# Altium schematic sheet Controller_Section.SchDoc
size A4; SheetNumber: 3; SheetTotal: 6
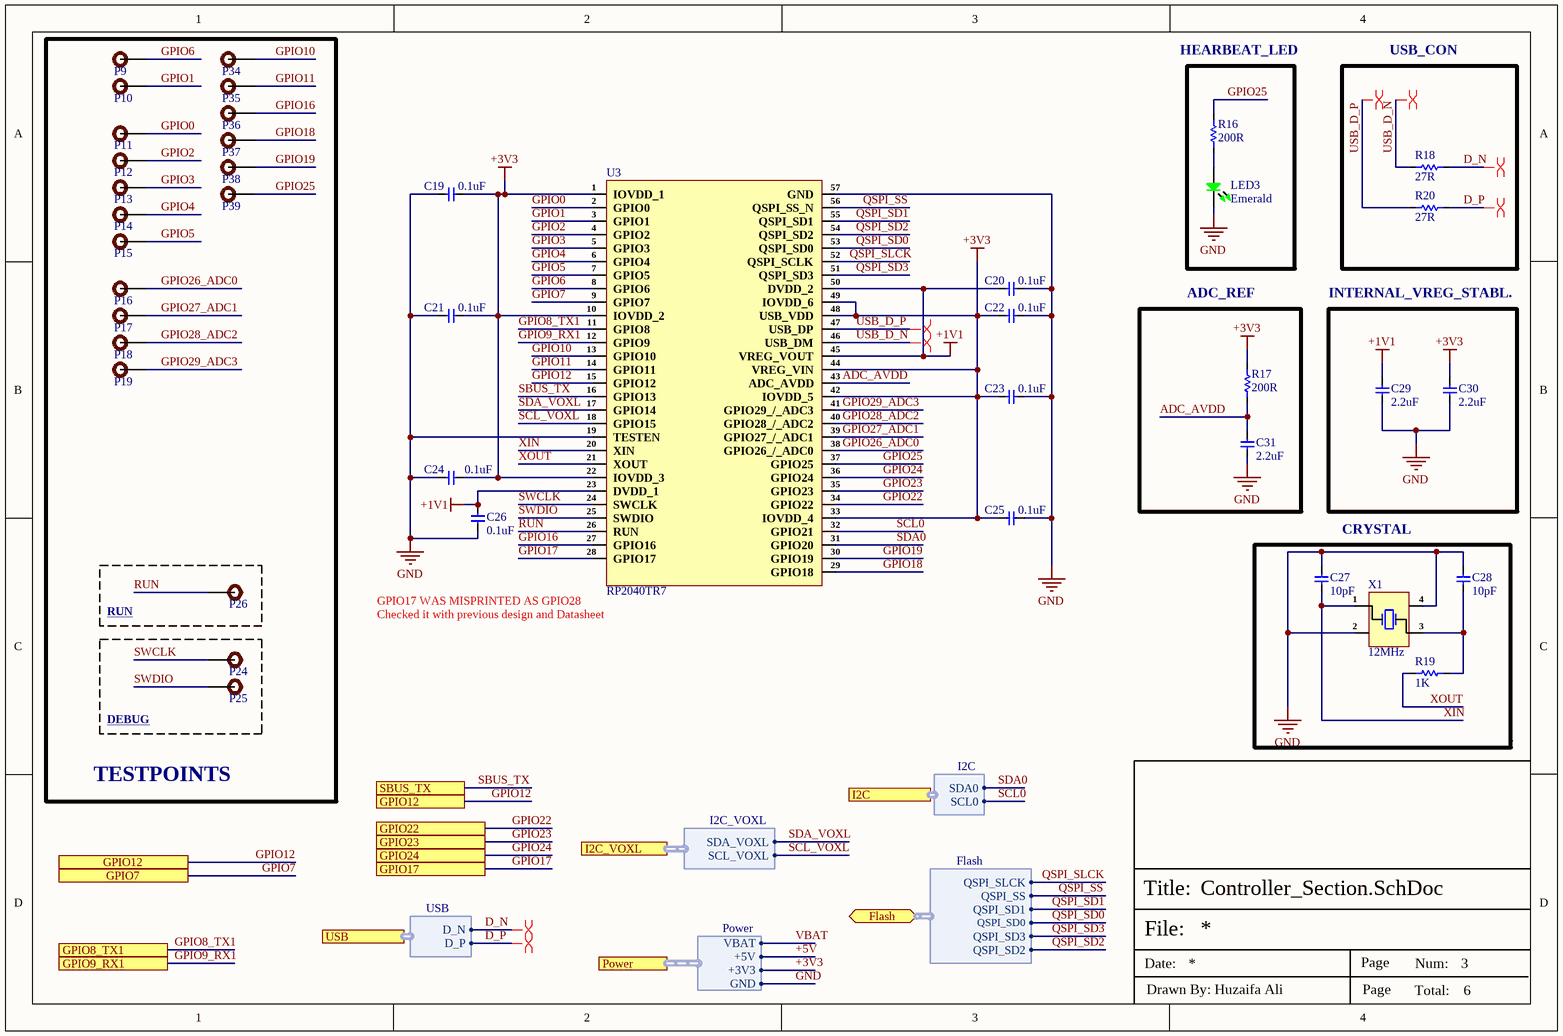
[diagram p0: Controller_Section.SchDoc]

## Parts
C19  0.1uF  [Cap-0603]
C20  0.1uF  [Cap-0603]
C21  0.1uF  [Cap-0603]
C22  0.1uF  [Cap-0603]
C23  0.1uF  [Cap-0603]
C24  0.1uF  [Cap-0603]
C25  0.1uF  [Cap-0603]
C26  0.1uF  [Cap-0603]
C27  10pF  [Cap-0603]
C28  10pF  [Cap-0603]
C29  2.2uF  [CAP-0603]
C30  2.2uF  [CAP-0603]
C31  2.2uF  [CAP-0603]
LED3  Emerald  [LED-0603]
P9  TEST POINT  [Test-point]  (value not drawn)
P10  TEST POINT  [Test-point]  (value not drawn)
P11  TEST POINT  [Test-point]  (value not drawn)
P12  TEST POINT  [Test-point]  (value not drawn)
P13  TEST POINT  [Test-point]  (value not drawn)
P14  TEST POINT  [Test-point]  (value not drawn)
P15  TEST POINT  [Test-point]  (value not drawn)
P16  TEST POINT  [Test-point]  (value not drawn)
P17  TEST POINT  [Test-point]  (value not drawn)
P18  TEST POINT  [Test-point]  (value not drawn)
P19  TEST POINT  [Test-point]  (value not drawn)
P24  TEST POINT  [Test-point]  (value not drawn)
P25  TEST POINT  [Test-point]  (value not drawn)
P26  TEST POINT  [Test-point]  (value not drawn)
P34  TEST POINT  [Test-point]  (value not drawn)
P35  TEST POINT  [Test-point]  (value not drawn)
P36  TEST POINT  [Test-point]  (value not drawn)
P37  TEST POINT  [Test-point]  (value not drawn)
P38  TEST POINT  [Test-point]  (value not drawn)
P39  TEST POINT  [Test-point]  (value not drawn)
R16  200R  [Res-0603]
R17  200R  [Res-0603]
R18  27R  [Res-0603]
R19  1K  [Res-0603]
R20  27R  [Res-0603]
U3  RP2040TR7  [QFN-56 (7x7)]
X1  12MHz  [MCSJK-7U-12.00-10-10-80-B-10]

## Blocks framed on the sheet
TESTPOINTS: P9-P19 P34-P39
USB_CON: R18 R20
ADC_REF: C31 R17
INTERNAL_VREG_STABL.: C29 C30
RUN: P26
DEBUG: P24 P25

## Ports
Flash (bidir, harness Flash, see Top-Sheet[3B], FlashMemory_Section[2D]), GPIO7 (see Top-Sheet[2B], Connector_Section[2D]), GPIO8_TX1 (see Top-Sheet[3C], WiFiModule_Section[2D]), GPIO9_RX1 (see Top-Sheet[3C], WiFiModule_Section[2D]), GPIO12 (see Top-Sheet[2C], Connector_Section[1D]), GPIO17 (see Top-Sheet[2C], Power_Section[2D]), GPIO22 (see Top-Sheet[2C], Power_Section[2D]), GPIO23 (see Top-Sheet[2C], Power_Section[2D]), GPIO24 (see Top-Sheet[2C], Power_Section[2D]), I2C (harness I2C, see Top-Sheet[2B], Connector_Section[1D]), I2C_VOXL (harness I2C_VOXL, see Top-Sheet[2B], Connector_Section[2D]), Power (harness Power, see Top-Sheet[2B], Connector_Section[4D], FlashMemory_Section[1D], Power_Section[3D], WiFiModule_Section[2D]), SBUS_TX (see Top-Sheet[2B], Connector_Section[1D]), USB (harness USB, see Top-Sheet[3C], WiFiModule_Section[2D])

## Harnesses
Flash: QSPI_SLCK, QSPI_SS, QSPI_SD1, QSPI_SD3, QSPI_SD0, QSPI_SD2
Power: +5V, +3V3, GND, VBAT
I2C_VOXL: SCL_VOXL, SDA_VOXL
I2C: SDA0, SCL0
USB: D_N, D_P

## Nets
+1V1: C20.2 C26.2 C29.2 U3.23(DVDD_1) U3.45(VREG_VOUT) U3.50(DVDD_2)
+3V3: C19.1 C21.1 C22.2 C23.2 C24.1 C25.2 C30.2 R17.2 U3.1(IOVDD_1) U3.10(IOVDD_2) U3.22(IOVDD_3) U3.33(IOVDD_4) U3.42(IOVDD_5) U3.44(VREG_VIN) U3.48(USB_VDD) U3.49(IOVDD_6) ; port Power.+3V3
GND: C19.2 C20.1 C21.2 C22.1 C23.1 C24.2 C25.1 C26.1 C27.2 C28.2 C29.1 C30.1 C31.1 LED3.2 U3.19(TESTEN) U3.57(GND) X1.2(GND) X1.4(VDD) ; port Power.GND
+5V: port Power.+5V
ADC_AVDD: C31.2 R17.1 U3.43(ADC_AVDD)
D_N: R18.2 ; port USB.D_N
D_P: R20.2 ; port USB.D_P
GPIO0: P11.1 U3.2(GPIO0)
GPIO1: P10.1 U3.3(GPIO1)
GPIO2: P12.1 U3.4(GPIO2)
GPIO3: P13.1 U3.5(GPIO3)
GPIO4: P14.1 U3.6(GPIO4)
GPIO5: P15.1 U3.7(GPIO5)
GPIO6: P9.1 U3.8(GPIO6)
GPIO7: U3.9(GPIO7) ; port GPIO7
GPIO8_TX1: U3.11(GPIO8) ; port GPIO8_TX1
GPIO9_RX1: U3.12(GPIO9) ; port GPIO9_RX1
GPIO10: P34.1 U3.13(GPIO10)
GPIO11: P35.1 U3.14(GPIO11)
GPIO12: U3.15(GPIO12) ; port GPIO12
GPIO16: P36.1 U3.27(GPIO16)
GPIO17: U3.28(GPIO17) ; port GPIO17
GPIO18: P37.1 U3.29(GPIO18)
GPIO19: P38.1 U3.30(GPIO19)
GPIO22: U3.34(GPIO22) ; port GPIO22
GPIO23: U3.35(GPIO23) ; port GPIO23
GPIO24: U3.36(GPIO24) ; port GPIO24
GPIO25: P39.1 R16.2 U3.37(GPIO25)
GPIO26_ADC0: P16.1 U3.38(GPIO26_/_ADC0)
GPIO27_ADC1: P17.1 U3.39(GPIO27_/_ADC1)
GPIO28_ADC2: P18.1 U3.40(GPIO28_/_ADC2)
GPIO29_ADC3: P19.1 U3.41(GPIO29_/_ADC3)
QSPI_SD0: U3.53(QSPI_SD0) ; port Flash.QSPI_SD0
QSPI_SD1: U3.55(QSPI_SD1) ; port Flash.QSPI_SD1
QSPI_SD2: U3.54(QSPI_SD2) ; port Flash.QSPI_SD2
QSPI_SD3: U3.51(QSPI_SD3) ; port Flash.QSPI_SD3
QSPI_SLCK: U3.52(QSPI_SCLK) ; port Flash.QSPI_SLCK
QSPI_SS: U3.56(QSPI_SS_N) ; port Flash.QSPI_SS
RUN: P26.1 U3.26(RUN)
SBUS_TX: U3.16(GPIO13) ; port SBUS_TX
SCL0: U3.32(GPIO21) ; port I2C.SCL0
SCL_VOXL: U3.18(GPIO15) ; port I2C_VOXL.SCL_VOXL
SDA0: U3.31(GPIO20) ; port I2C.SDA0
SDA_VOXL: U3.17(GPIO14) ; port I2C_VOXL.SDA_VOXL
SWCLK: P24.1 U3.24(SWCLK)
SWDIO: P25.1 U3.25(SWDIO)
USB_D_N: R18.1 U3.46(USB_DM)
USB_D_P: R20.1 U3.47(USB_DP)
VBAT: port Power.VBAT
XIN: C27.1 U3.20(XIN) X1.1(ENABLE_CONTROL)
XOUT: R19.1 U3.21(XOUT)
NetC28_1: C28.1 R19.2 X1.3(OUT_PUT)
NetLED3_1: LED3.1 R16.1

## Layout directives
differential pair; net class USB_D; differential pair class USB_D_Lines; rule Matched Net Lengths [Tolerance = 0.508mm]; rule Impedance Constraint [Min = 88.00    Max = 102.0    ]: USB_D_N, USB_D_P
differential pair; rule Impedance Constraint [Min = 88.00    Max = 102.0    ]; rule Matched Net Lengths [Tolerance = 0.508mm]; net class D; differential pair class D_Lines: D_N, D_P

## Notes on the sheet
- HEARBEAT_LED
- (near C27) CRYSTAL
- (near U3) GPIO17 WAS MISPRINTED AS GPIO28
  Checked it with previous design and Datasheet
- File:
- Title:
- Date:
- Page
- Num:
- Total:
- Drawn By: Huzaifa Ali

## Library data of the parts
C19-C26 = CL10B104KB8NNNC: CAP CER 0.1UF 50V X7R 0603; Manufacturer: Samsung; Material: Ceramic; Capacitance: 100nF; Tolerance: 10%; Supplier 1: Digi-Key; Manufacturer Part Number: CL10B104KB8NNNC; RoHS: Yes; Category: Ceramic Capacitors; Stock 1: 3998791; Pricing 1: 1=0.10000, 10=0.03000, 50=0.01640, 100=0.01340, 500=0.00954, 1000=0.00750 (USD); Mount: Surface Mount; Case/Package: 0603; Case Code (Metric): 1608; Case Code (Imperial): 0603; Contact Plating: Tin; Min Operating Temperature: -55°C; Max Operating Temperature: 125°C; Dielectric: X7R; Voltage Rating: 50V; Package Quantity: 1; Packaging: Tape and Reel; Voltage: 50V; Voltage Rating (DC): 50V; Series: CL; Construction: Flat; Length: 1.6mm; Width: 0.031inch; Height: 0.8mm; Depth: 0.8mm; Thickness: 0.035inch; Radiation Hardening: No; Lead Free: Lead Free; RoHS Compliant: Yes; ComponentLink1URL: https://datasheet.ciiva.com/25803/cl10b104kb8nnnc-25803393.pdf?src-supplier=Digi-Key; ComponentLink1Description: https://datasheet.ciiva.com/25803/cl10b104kb8nnnc-25803393.pdf?src-supplier=Digi-Key; ComponentLink2URL: https://datasheet.ciiva.com/26838/getdatasheetpartid-89097-26838411.pdf?src-supplier=Verical; ComponentLink2Description: https://datasheet.ciiva.com/26838/getdatasheetpartid-89097-26838411.pdf?src-supplier=Verical; ComponentLink3URL: https://datasheet.ciiva.com/29198/456651-da-01-en-vs-kondensator-0605-29198839.pdf?src-supplier=Conrad; ComponentLink3Description: https://datasheet.ciiva.com/29198/456651-da-01-en-vs-kondensator-0605-29198839.pdf?src-supplier=Conrad; Supplier Part Number 1: 1276-1000-1-ND; LCSC Part Number: C1591
C27 C28 = CC0603JRNPO9BN100: CAP CER 10PF 50V C0G/NPO 0603; Manufacturer: Yageo; Tolerance: 5%; Dielectric: C0G; Temperature Coefficient: 30ppm/°C; Insulation Resistance: 100GR; ComponentLink1URL: https://datasheet.ciiva.com/25787/cl10a475ka8nqnc-25787017.pdf?src-supplier=Digi-Key; ComponentLink1Description: https://datasheet.ciiva.com/25787/cl10a475ka8nqnc-25787017.pdf?src-supplier=Digi-Key; ComponentLink2URL: https://datasheet.ciiva.com/144/mlccorderingcode-144651.pdf?src-supplier=Digi-Key; ComponentLink2Description: https://datasheet.ciiva.com/144/mlccorderingcode-144651.pdf?src-supplier=Digi-Key; ComponentLink3URL: https://datasheet.ciiva.com/11786/0900766b8079c870-11786407.pdf?src-supplier=RSComponents; ComponentLink3Description: https://datasheet.ciiva.com/11786/0900766b8079c870-11786407.pdf?src-supplier=RSComponents; ComponentLink4URL: https://datasheet.ciiva.com/5789/1734582-5789616.pdf?src-supplier=Farnell; ComponentLink4Description: https://datasheet.ciiva.com/5789/1734582-5789616.pdf?src-supplier=Farnell; ComponentLink5URL: https://datasheet.ciiva.com/26862/getdatasheetpartid-403524-26862758.pdf?src-supplier=Verical; ComponentLink5Description: https://datasheet.ciiva.com/26862/getdatasheetpartid-403524-26862758.pdf?src-supplier=Verical; ComponentLink6URL: https://datasheet.ciiva.com/7978/1132289-7978126.pdf?src-supplier=Element14; ComponentLink6Description: https://datasheet.ciiva.com/7978/1132289-7978126.pdf?src-supplier=Element14; ComponentLink7URL: https://datasheet.ciiva.com/46430/1835847-46430150.pdf?src-supplier=Element14; ComponentLink7Description: https://datasheet.ciiva.com/46430/1835847-46430150.pdf?src-supplier=Element14; ComponentLink8URL: https://datasheet.ciiva.com/144/mlccorderingcode-144650.pdf?src-supplier=Digi-Key; ComponentLink8Description: https://datasheet.ciiva.com/144/mlccorderingcode-144650.pdf?src-supplier=Digi-Key; ComponentLink9URL: https://datasheet.ciiva.com/144/mlccorderingcode-144649.pdf?src-supplier=Digi-Key; ComponentLink9Description: https://datasheet.ciiva.com/144/mlccorderingcode-144649.pdf?src-supplier=Digi-Key; ComponentLink10URL: https://datasheet.ciiva.com/5425/upy-gp-np0-16v-to-50v-8-5425564.pdf?src-supplier=Mouser; ComponentLink10Description: https://datasheet.ciiva.com/5425/upy-gp-np0-16v-to-50v-8-5425564.pdf?src-supplier=Mouser; ComponentLink11URL: https://datasheet.ciiva.com/8033/1734582-8033710.pdf?src-supplier=Element14; ComponentLink11Description: https://datasheet.ciiva.com/8033/1734582-8033710.pdf?src-supplier=Element14; ComponentLink12URL: https://datasheet.ciiva.com/8033/1734582-8033706.pdf?src-supplier=Element14; ComponentLink12Description: https://datasheet.ciiva.com/8033/1734582-8033706.pdf?src-supplier=Element14; Supplier 1: Digi-Key; Manufacturer Part Number: CC0603JRNPO9BN100; RoHS: Yes; Category: Ceramic Capacitors; Stock 1: 1700978; Pricing 1: 1=0.10000, 10=0.03900, 50=0.02120, 100=0.01740, 500=0.01240, 1000=0.00974 (USD); Mount: Surface Mount; Case/Package: 0603; Number of Pins: 2; Case Code (Metric): 1608; Case Code (Imperial): 0603; Min Operating Temperature: -55°C; Max Operating Temperature: 125°C; Capacitance: 10pF; Voltage: 50V; Voltage Rating: 50V; Voltage Rating (DC): 50V; Packaging: Tape and Reel; Package Quantity: 1; Termination: SMD/SMT; Resistor Type: Ceramic; Series: CC; Length: 1.6mm; Width: 0.031inch; Height: 0.8mm; Thickness: 0.035inch; Depth: 0.8mm; Radiation Hardening: No; RoHS Compliant: Yes; REACH SVHC: No SVHC; Lead Free: Lead Free; Supplier Part Number 1: 311-1058-1-ND; LCSC Part Number: C106245
C29-C31 = CC0603KRX5R8BB225: CAP CER 2.2UF 25V X5R 0603; Manufacturer: Yageo; Tolerance: 10%; Item Type: Capacitor; Supplier 1: Digi-Key; Manufacturer Part Number: CC0603KRX5R8BB225; Stock 1: 687936; Pricing 1: 1=0.4, 10=0.276, 50=0.1932, 100=0.1656, 500=0.1242, 1000=0.10488 (USD); Mount: Surface Mount; Case/Package: 0603; Case Code (Metric): 1608; Case Code (Imperial): 0603; Weight: 7.1E-05oz; Min Operating Temperature: -55°C; Max Operating Temperature: 85°C; Packaging: Tape and Reel; Capacitance: 2.2uF; Dielectric: X5R; Voltage Rating: 25V; Termination: SMD/SMT; Resistor Type: Ceramic; Voltage Rating (DC): 25V; Package Quantity: 4000; Length: 1.6mm; Width: 0.031inch; Thickness: 0.037inch; Depth: 0.8mm; Radiation Hardening: No; Lead Free: Lead Free; Halogen Free: Halogen Free; RoHS Compliant: Yes; ComponentLink1URL: https://www.verical.com/server-webapp/html/getDatasheet?partID=782757&src-supplier=Verical; ComponentLink1Description: https://www.verical.com/server-webapp/html/getDatasheet?partID=782757&src-supplier=Verical; Supplier Part Number 1: 311-1786-1-ND; LCSC Part Number: C309478
LED3 = NCD0603G2: Emerald 0603 Light Emitting Diodes (LED) ROHS; Manufacturer: Foshan NationStar Optoelectronics; Manufacturer Part Number: NCD0603G2; Package: 0603; LCSC Part Number: C87326; Item Type: LED; ComponentLink1Description: LCSC; ComponentLink1URL: https://www.lcsc.com/product-detail/Light-Emitting-Diodes-LED_Foshan-NationStar-Optoelectronics-NCD0603G2_C87326.html
P9-P19 P24-P26 P34-P39 = TEST POINT: Test Point ON; Item Type: TEST POINT; Manufacturer Part Number: TEST POINT
R16 R17 = RT0603DRD07200RL: RES SMD 200 OHM 0.5% 1/10W 0603; Manufacturer: Yageo; Power Rating: 100mW; Voltage Rating (DC): 50V; Supplier 1: Digi-Key; Manufacturer Part Number: RT0603DRD07200RL; Stock 1: 19572; Pricing 1: 1=0.21, 10=0.174, 100=0.0682, 1000=0.02855, 2500=0.02617 (USD); Case/Package: 0603; Resistance: 200R; Tolerance: 0.5%; Packaging: Cut Tape; Lead Free: Lead Free; Supplier Part Number 1: 311-200DCT-ND; LCSC Part Number: C700498
R18 R20 = RC0603FR-0727RL: RES 27 OHM 1% 1/10W 0603; Manufacturer: Yageo; Voltage Rating (DC): 50V; Temperature Coefficient: 100ppm/°C; Power Rating: 100mW; Item Type: Resistor; Supplier 1: Future Electronics; Manufacturer Part Number: RC0603FR-0727RL; RoHS: Yes; Category: Chip SMD Resistors; Stock 1: 285000; Pricing 1: 5000=0.0015, 50000=0.0014, 200000=0.0014, 625000=0.0013, 2000000=0.0012 (USD); Case/Package: 0603; Pins: 2; Case Code (Metric): 1608; Case Code (Imperial): 0603; Min Operating Temperature: -55°C; Max Operating Temperature: 155°C; Value: 27R; Tolerance: 1%; Packaging: Tape and Reel; Resistor Type: Thick Film; Number of Terminations: 2; Voltage Rating: 50V; Termination: SMD/SMT; Max Power Dissipation: 100mW; Features: Moisture Resistant; Series: RC; Resistance Tolerance: 1%; Width: 0.8mm; Lead Free: Lead Free; Reach SVHC Compliant: Unknown; RoHS Compliant: Yes; ComponentLink1URL: https://datasheet.ciiva.com/2454/pyu-r-int-thick-7-2454031.pdf?src-supplier=Digi-Key; ComponentLink1Description: https://datasheet.ciiva.com/2454/pyu-r-int-thick-7-2454031.pdf?src-supplier=Digi-Key; ComponentLink2URL: https://datasheet.ciiva.com/2454/pyu-r-int-thick-7-2454032.pdf?src-supplier=Digi-Key; ComponentLink2Description: https://datasheet.ciiva.com/2454/pyu-r-int-thick-7-2454032.pdf?src-supplier=Digi-Key; ComponentLink3URL: https://datasheet.ciiva.com/2454/pyu-r-int-thick-7-2454030.pdf?src-supplier=Digi-Key; ComponentLink3Description: https://datasheet.ciiva.com/2454/pyu-r-int-thick-7-2454030.pdf?src-supplier=Digi-Key; ComponentLink4URL: https://datasheet.ciiva.com/7746/443971-7746313.pdf?src-supplier=Element14; ComponentLink4Description: https://datasheet.ciiva.com/7746/443971-7746313.pdf?src-supplier=Element14; ComponentLink5URL: https://datasheet.ciiva.com/7746/443971-7746314.pdf?src-supplier=Element14; ComponentLink5Description: https://datasheet.ciiva.com/7746/443971-7746314.pdf?src-supplier=Element14; Supplier Part Number 1: 9798455; LCSC Part Number: C137753
R19 = RT0603DRD071KL: RES SMD 1K OHM 0.5% 1/10W 0603; Manufacturer: Yageo; Resistance: 1kR; Temperature Coefficient: 25ppm/°C; Power Rating: 100mW; Voltage Rating: 75V; Voltage Rating (DC): 50V; Supplier 1: Digi-Key; Manufacturer Part Number: RT0603DRD071KL; Stock 1: 178947; Pricing 1: 1=0.2, 10=0.167, 100=0.0651, 1000=0.02725, 2500=0.02498 (USD); Case/Package: 0603; Contact Plating: Tin,Matte; Case Code (Metric): 1608; Case Code (Imperial): 0603; Min Operating Temperature: -55°C; Max Operating Temperature: 125°C; Tolerance: 0.5%; Composition: Thin Film; Packaging: Tape and Reel; Termination: SMD/SMT; Radiation Hardening: No; Lead Free: Lead Free; ComponentLink1URL: http://www.mouser.com/ds/2/447/yageodocoutput-1125656.pdf?src-supplier=Mouser; ComponentLink1Description: http://www.mouser.com/ds/2/447/yageodocoutput-1125656.pdf?src-supplier=Mouser; ComponentLink2URL: http://www.yageo.com/documents/recent/PYu-RT_1-to-0.05_RoHS_L_6.pdf?src-supplier=Avnet; ComponentLink2Description: http://www.yageo.com/documents/recent/PYu-RT_1-to-0.05_RoHS_L_6.pdf?src-supplier=Avnet; Supplier Part Number 1: 311-1.0KDDKR-ND; LCSC Part Number: C165964
U3 = RP2040TR7: Rectifier Diode, 1 Phase, 1 Element, 2A, 400V V(RRM), Silicon, DO-15; Manufacturer: Raspberry Pi; Supplier: Farnell; Supplier Part Number: 3766079; Manufacturer Part Number: RP2040TR7; RoHS: No; Category: Uncategorized; Stock: 11495; Pricing: 500=0.645 (GBP)
X1 = MCSJK-7U-12.00-10-10-80-B-10: Crystal, 12Mhz, 10Pf, 3.2Mm X 2.5Mm Frequency Nom 12Mhz Crystal Case Smd Rohs; Manufacturer: Multicomp; Supplier: Newark; Supplier Part Number: 56AC8904; Manufacturer Part Number: MCSJK-7U-12.00-10-10-80-B-10; RoHS: Yes; Stock: 26807; Pricing: 1=0.428, 10=0.381, 100=0.3, 500=0.246, 1000=0.214, 5000=0.191, 10000=0.172, 25000=0.166 (USD); ComponentLink1URL: http://www.farnell.com/datasheets/2645227.pdf?src-supplier=Farnell; ComponentLink1Description: http://www.farnell.com/datasheets/2645227.pdf?src-supplier=Farnell; Item Type: Crystal